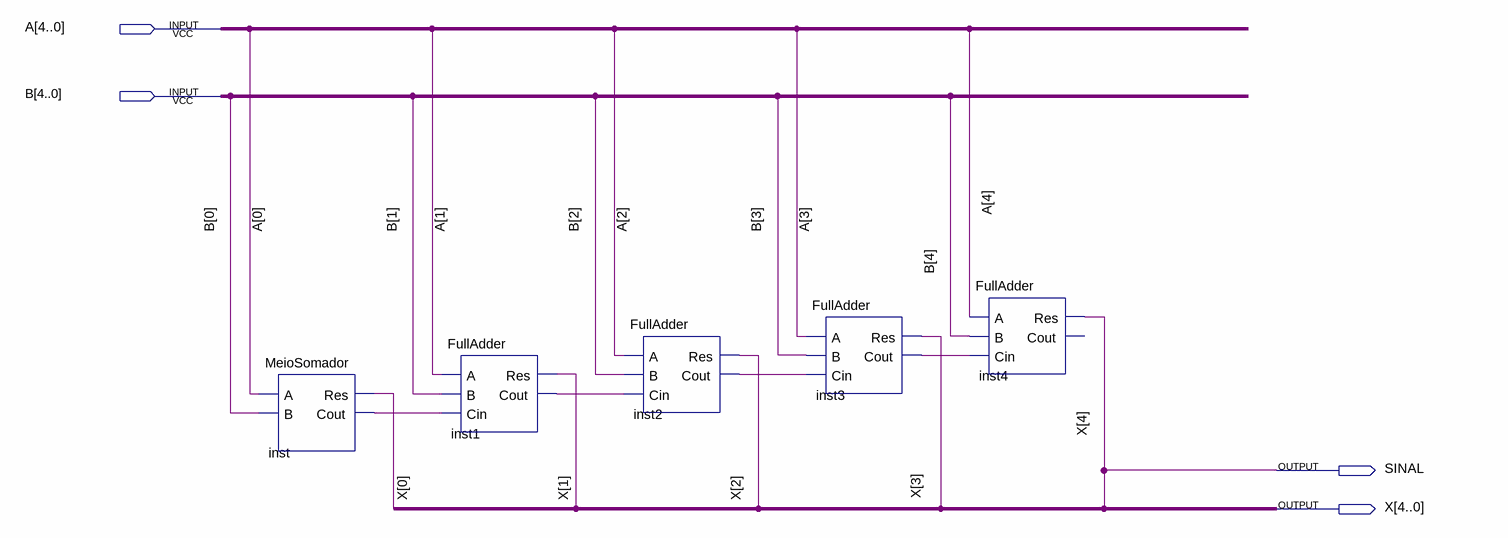
[diagram p0: schematic sheet]
// Quartus schematic Somador5Bits.bdf as structural Verilog: 5 symbols, 4 pins
module Somador5Bits (
  input  [4:0] A,
  input  [4:0] B,
  output SINAL,
  output [4:0] X
);

  wire inst1_cout, inst2_cout, inst3_cout, inst_cout;

  MeioSomador inst (.A(A[0]), .B(B[0]), .Res(X[0]), .Cout(inst_cout));
  FullAdder inst1 (.A(A[1]), .B(B[1]), .Cin(inst_cout), .Res(X[1]), .Cout(inst1_cout));
  FullAdder inst2 (.A(A[2]), .B(B[2]), .Cin(inst1_cout), .Res(X[2]), .Cout(inst2_cout));
  FullAdder inst3 (.A(A[3]), .B(B[3]), .Cin(inst2_cout), .Res(X[3]), .Cout(inst3_cout));
  FullAdder inst4 (.A(A[4]), .B(B[4]), .Cin(inst3_cout), .Res(SINAL));  // open: Cout

  assign X[4] = SINAL;
endmodule
